# Altium schematic sheet 04_Conectores.SchDoc
size A; SheetNumber: 4; SheetTotal: 4
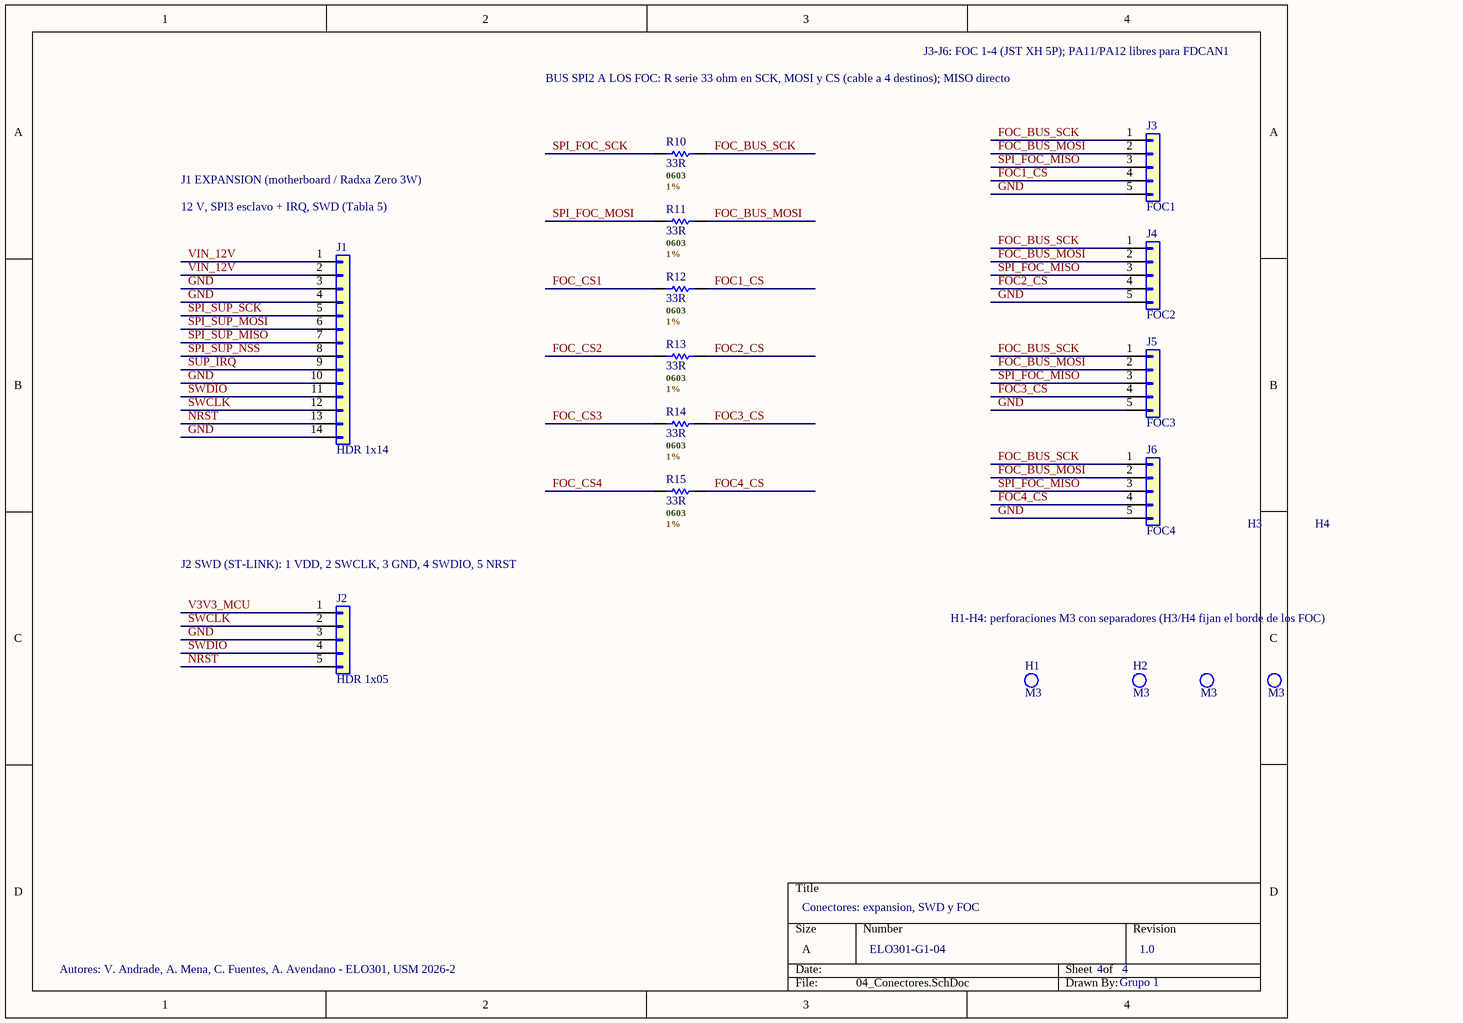
[diagram p0: 04_Conectores.SchDoc]

## Parts
H1  M3  [M3 - HOLE]
H2  M3  [M3 - HOLE]
H3  M3  [M3 - HOLE]
H4  M3  [M3 - HOLE]
J1  HDR 1x14  [HDR 1x14 2.54 - BOOMELE]
J2  HDR 1x05  [HDR 1x05 2.54 - BOOMELE]
J3  FOC1  [B5B-XH-A - JST]
J4  FOC2  [B5B-XH-A - JST]
J5  FOC3  [B5B-XH-A - JST]
J6  FOC4  [B5B-XH-A - JST]
R10  33R  .Case/Package: 0603  .Tolerance: 1%  [R0603 - YAGEO]
R11  33R  .Case/Package: 0603  .Tolerance: 1%  [R0603 - YAGEO]
R12  33R  .Case/Package: 0603  .Tolerance: 1%  [R0603 - YAGEO]
R13  33R  .Case/Package: 0603  .Tolerance: 1%  [R0603 - YAGEO]
R14  33R  .Case/Package: 0603  .Tolerance: 1%  [R0603 - YAGEO]
R15  33R  .Case/Package: 0603  .Tolerance: 1%  [R0603 - YAGEO]

## Nets
FOC1_CS: J3.4(Pin_4) R12.2
FOC2_CS: J4.4(Pin_4) R13.2
FOC3_CS: J5.4(Pin_4) R14.2
FOC4_CS: J6.4(Pin_4) R15.2
FOC_BUS_MOSI: J3.2(Pin_2) J4.2(Pin_2) J5.2(Pin_2) J6.2(Pin_2) R11.2
FOC_BUS_SCK: J3.1(Pin_1) J4.1(Pin_1) J5.1(Pin_1) J6.1(Pin_1) R10.2
FOC_CS1: R12.1
FOC_CS2: R13.1
FOC_CS3: R14.1
FOC_CS4: R15.1
GND: J1.3(Pin_3) J1.4(Pin_4) J1.10(Pin_10) J1.14(Pin_14) J2.3(Pin_3) J3.5(Pin_5) J4.5(Pin_5) J5.5(Pin_5) J6.5(Pin_5)
NRST: J1.13(Pin_13) J2.5(Pin_5)
SPI_FOC_MISO: J3.3(Pin_3) J4.3(Pin_3) J5.3(Pin_3) J6.3(Pin_3)
SPI_FOC_MOSI: R11.1
SPI_FOC_SCK: R10.1
SPI_SUP_MISO: J1.7(Pin_7)
SPI_SUP_MOSI: J1.6(Pin_6)
SPI_SUP_NSS: J1.8(Pin_8)
SPI_SUP_SCK: J1.5(Pin_5)
SUP_IRQ: J1.9(Pin_9)
SWCLK: J1.12(Pin_12) J2.2(Pin_2)
SWDIO: J1.11(Pin_11) J2.4(Pin_4)
V3V3_MCU: J2.1(Pin_1)
VIN_12V: J1.1(Pin_1) J1.2(Pin_2)

## Notes on the sheet
- BUS SPI2 A LOS FOC: R serie 33 ohm en SCK, MOSI y CS (cable a 4 destinos); MISO directo
- J3-J6: FOC 1-4 (JST XH 5P); PA11/PA12 libres para FDCAN1
- J1 EXPANSION (motherboard / Radxa Zero 3W)
- (near J1) 12 V, SPI3 esclavo + IRQ, SWD (Tabla 5)
- (near J2) J2 SWD (ST-LINK): 1 VDD, 2 SWCLK, 3 GND, 4 SWDIO, 5 NRST
- H1-H4: perforaciones M3 con separadores (H3/H4 fijan el borde de los FOC)
- Conectores: expansion, SWD y FOC
- Autores: V. Andrade, A. Mena, C. Fuentes, A. Avendano - ELO301, USM 2026-2
- ELO301-G1-04
- 4
- 1.0
- Grupo 1

## Library data of the parts
H1-H4 = MOUNTING HOLE - M3: Mounting Hole without connection, M3
  H1 H2: Manufacturer: -; Manufacturer Part Number: M3
J1 = BOOMELE 2.54-1x14: CONN HEADER 40POS 2.54mm SINGLE ROW TH (tira 1x40 cortada a 1x14); Manufacturer: BOOMELE(Boom Precision Elec); Manufacturer Part Number: 2.54-1*40P; Supplier 1: LCSC; Supplier Part Number 1: C2337; Category: Headers, Male Pins; Case/Package: Through Hole, P=2.54mm; Operating Temperature: -55°C ~ 105°C; Lifecycle Status: Active; ComponentLink1Description: Datasheet; ComponentLink1URL: https://www.lcsc.com/datasheet/C2337.pdf; ComponentLink2Description: LCSC; ComponentLink2URL: https://www.lcsc.com/product-detail/C2337.html; Nota DigiKey: No disponible en DigiKey: estandar del ramo (tira BOOMELE)
J2 = BOOMELE 2.54-1x05: CONN HEADER 40POS 2.54mm SINGLE ROW TH (tira 1x40 cortada a 1x5); Manufacturer: BOOMELE(Boom Precision Elec); Manufacturer Part Number: 2.54-1*40P; Supplier 1: LCSC; Supplier Part Number 1: C2337; Category: Headers, Male Pins; Case/Package: Through Hole, P=2.54mm; Operating Temperature: -55°C ~ 105°C; Lifecycle Status: Active; ComponentLink1Description: Datasheet; ComponentLink1URL: https://www.lcsc.com/datasheet/C2337.pdf; ComponentLink2Description: LCSC; ComponentLink2URL: https://www.lcsc.com/product-detail/C2337.html; Nota DigiKey: No disponible en DigiKey: estandar del ramo (tira BOOMELE)
J3-J6 = B5B-XH-A(LF)(SN): Connector Header Through Hole 5 position 0.098" (2.50mm); Manufacturer: JST Sales America Inc.; Manufacturer Part Number: B5B-XH-A(LF)(SN); Supplier 1: DigiKey; Supplier Part Number 1: 455-B5B-XH-A-ND; Supplier 2: LCSC; Supplier Part Number 2: C157991; Category: Headers, Male Pins; Case/Package: Through Hole; Operating Temperature: -25°C ~ 85°C; Lifecycle Status: Active; ComponentLink1Description: Datasheet; ComponentLink1URL: https://www.jst-mfg.com/product/pdf/eng/eXH.pdf; ComponentLink2Description: DigiKey; ComponentLink2URL: https://www.digikey.com/en/products/result?keywords=B5B-XH-A
R10-R15 = RESISTOR - GENERIC: 33 Ohms ±1% 0.1W, 1/10W Chip Resistor 0603 (1608 Metric) Moisture Resistant Thick Film; Manufacturer: YAGEO; Manufacturer Part Number: RC0603FR-0733RL; Case/Package: 0603; Tolerance: 1%; Supplier 1: DigiKey; Supplier Part Number 1: 13-RC0603FR-0733RLCT-ND; Supplier 2: LCSC; Supplier Part Number 2: C108661; Category: Chip Resistor - Surface Mount; Operating Temperature: -55°C ~ 155°C; Lifecycle Status: Active; ComponentLink1Description: Datasheet; ComponentLink1URL: https://yageogroup.com/content/datasheet/asset/file/PYU-RC_GROUP_51_ROHS_L; ComponentLink2Description: DigiKey; ComponentLink2URL: https://www.digikey.com/en/products/result?keywords=RC0603FR-0733RL